# Altium schematic sheet RF_SWITCH.SchDoc
size A; SheetNumber: 5; SheetTotal: 12
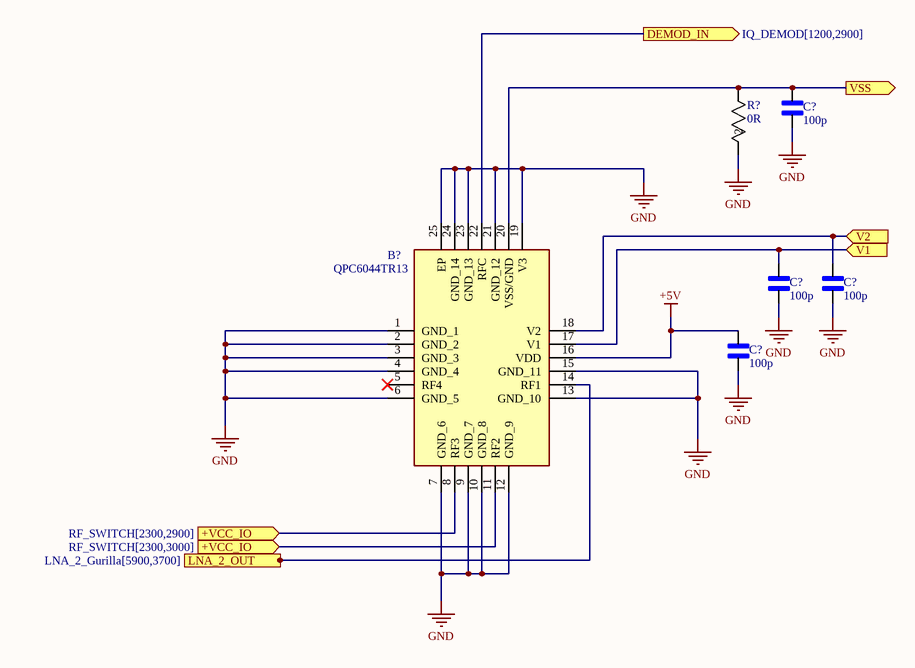
[diagram p0: RF_SWITCH.SchDoc]

## Parts
(Parts that share a designator on the sheet are numbered #1, #2 ... from top to bottom, then left to right.)
B?  QPC6044TR13  [QFN50P400X400X80-25N-D]
C?#1  100p  [CAPC1005X55N]
C?#2  100p  [CAPC1005X55N]
C?#3  100p  [CAPC1005X55N]
C?#4  100p  [CAPC1005X55N]
R?  0R  [RC0402N_PAN]

## Ports
+VCC_IO (in, see RF_SWITCH[2300,2900]), +VCC_IO (in, see RF_SWITCH[2300,3000]), DEMOD_IN (out, see IQ_DEMOD[1200,2900]), LNA_2_OUT (in, see LNA_2_Gurilla[5900,3700]), V1 (in), V2 (in), VSS (out)

## Nets
+5V: B?.16(VDD) C?#4.2
GND: B?.1(GND_1) B?.2(GND_2) B?.3(GND_3) B?.4(GND_4) B?.6(GND_5) B?.7(GND_6) B?.9(GND_7) B?.10(GND_8) B?.12(GND_9) B?.13(GND_10) B?.15(GND_11) B?.19(V3) B?.21(GND_12) B?.23(GND_13) B?.24(GND_14) B?.25(EP) C?#1.1 C?#2.1 C?#3.1 C?#4.1 R?.2
+VCC_IO: B?.8(RF3) B?.11(RF2) ; port +VCC_IO
DEMOD_IN: B?.22(RFC) ; port DEMOD_IN
LNA_2_OUT: B?.14(RF1) ; port LNA_2_OUT
V1: B?.17(V1) C?#2.2 ; port V1
V2: B?.18(V2) C?#3.2 ; port V2
VSS: B?.20(VSS/GND) C?#1.2 R?.1 ; port VSS

Not connected (* = marked no-connect by the designer): B? 5(RF4)*

## Library data of the parts
B? = QPC6044TR13: 5 - 6000 MHz Absorptive High Isolation SP4T Switch; Manufacturer_Name: Qorvo; Geometry.Height: 0.8mm; Mouser Part Number: 772-QPC6044TR; Mouser Price/Stock: https://www.mouser.co.uk/ProductDetail/Qorvo/QPC6044TR13?qs=AZxAKFb3YN%252BZtJBrTRUA2g%3D%3D; Manufacturer_Part_Number: QPC6044TR13; Datasheet Link: https://www.qorvo.com/products/d/da000272
C?#1-C?#4 = UMK105CG101JV-F-100p: 100 pF Â±5% 50V Ceramic Capacitor C0G, NP0 0402 (1005 Metric); MANUFACTURER: Taiyo Yuden; Package: 1005 Taiyo Yuden; MPN: UMK105CG101JV-F; DATASHEET_URL: https://ds.yuden.co.jp/TYCOMPAS/ut/detail?pn=UMK105CG101JV-F  &u=M; Value: *; SOURCE_URL: https://www.snapeda.com/parts/UMK105CG101JV-F/Taiyo+Yuden/view-part/
R? = ERJ-2GE0R00X-0R: RESISTOR; 0402; 0 OHM; 0%; JUMPER; 0.10W; THICK FILM; Manufacturer_Name: Panasonic; Copyright: Copyright (C) 2025 Ultra Librarian. All rights reserved.; Manufacturer_Part_Number: ERJ-2GE0R00X